# Altium schematic sheet [8] Sockets.SchDoc
size B; Organization: Altium Limited; Address1: L3, 12a Rodborough Rd; Address2: Frenchs Forest; Address3: NSW; Address4: Australia 2086
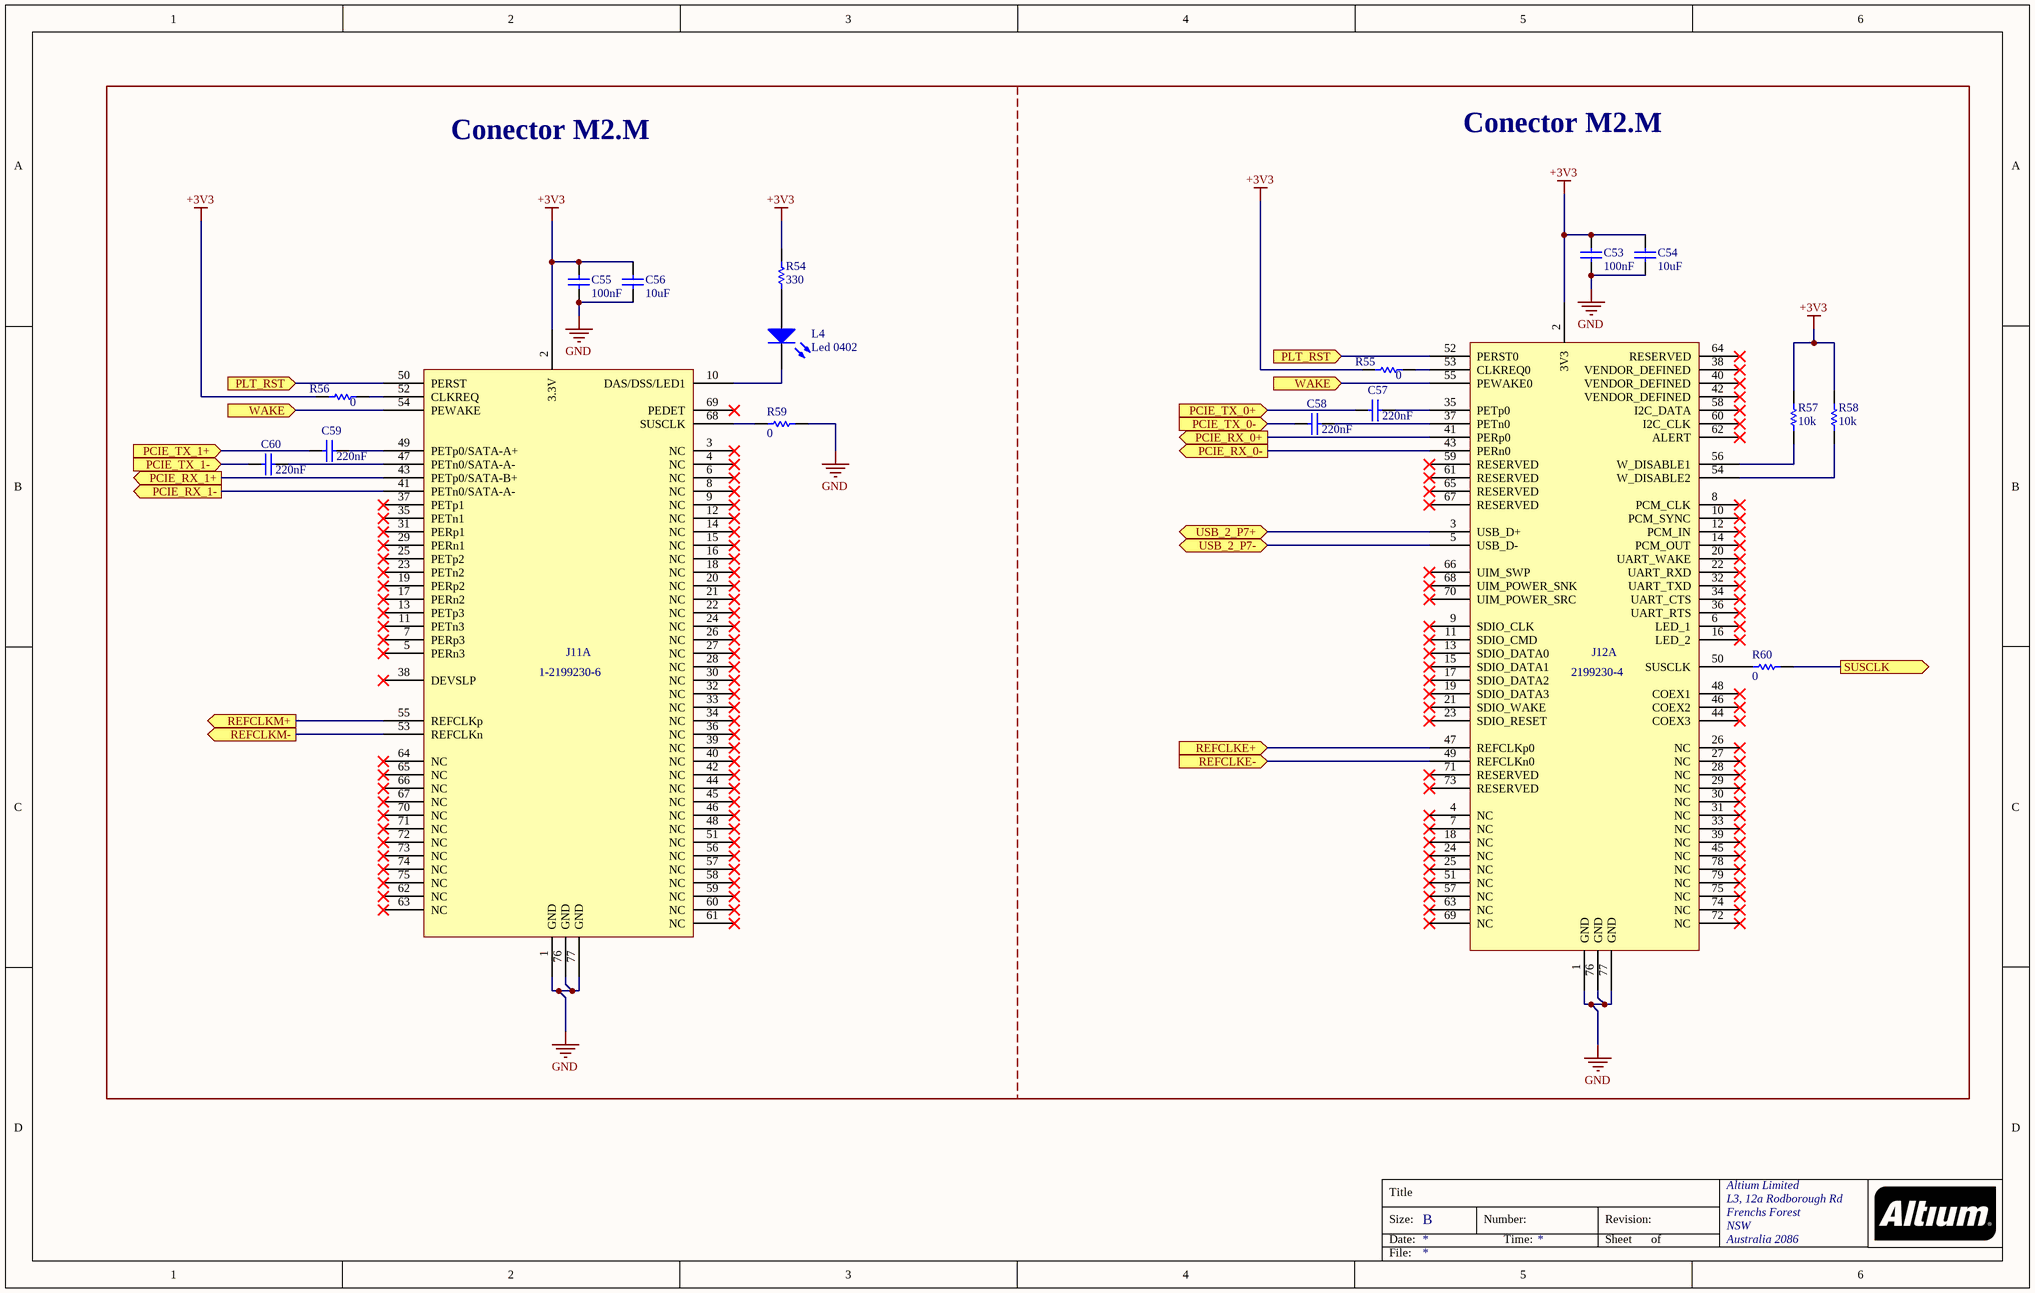
[diagram p0: [8] Sockets.SchDoc]

## Parts
C53  100nF  [Capacitor 0402]
C54  10uF  [Capacitor 0402]
C55  100nF  [Capacitor 0402]
C56  10uF  [Capacitor 0402]
C57  220nF  [Capacitor 0402]
C58  220nF  [Capacitor 0402]
C59  220nF  [Capacitor 0402]
C60  220nF  [Capacitor 0402]
J11  1-2199230-6  [CONN67_2199230_TEC]  (part A of 2)
J12  2199230-4  [CONN67_2199230_TEC]  (part A of 2)
L4  Led 0402  [LED 0402]
R54  330  [Resistencia 0402]
R55  0  [Resistencia 0402]
R56  0  [Resistencia 0402]
R57  10k  [Resistencia 0402]
R58  10k  [Resistencia 0402]
R59  0  [Resistencia 0402]
R60  0  [Resistencia 0402]

## Ports
PCIE_RX_0+ (out), PCIE_RX_0- (out), PCIE_RX_1+ (out), PCIE_RX_1- (out), PCIE_TX_0+ (in), PCIE_TX_0- (in), PCIE_TX_1+ (in), PCIE_TX_1- (in), PLT_RST (in), REFCLKE+ (in), REFCLKE- (in), REFCLKM+ (out), REFCLKM- (out), SUSCLK (out), USB_2_P7+ (bidir), USB_2_P7- (bidir), WAKE (in)

## Nets
+3V3: C53.2 C54.2 C55.2 C56.2 J11.2(3.3V) J12.2(3V3) R54.2(B) R55.1(A) R56.1(A) R57.2(B) R58.2(B)
GND: C53.1 C54.1 C55.1 C56.1 J11.1(GND) J11.76(GND) J11.77(GND) J12.1(GND) J12.76(GND) J12.77(GND) R59.1(A)
PCIE_RX_0+: J12.41(PERp0) ; port PCIE_RX_0+
PCIE_RX_0-: J12.43(PERn0) ; port PCIE_RX_0-
PCIE_RX_1+: J11.43(PETp0/SATA-B+) ; port PCIE_RX_1+
PCIE_RX_1-: J11.41(PETn0/SATA-A-) ; port PCIE_RX_1-
PCIE_TX_0+: C57.2 ; port PCIE_TX_0+
PCIE_TX_0-: C58.2 ; port PCIE_TX_0-
PCIE_TX_1+: C59.2 ; port PCIE_TX_1+
PCIE_TX_1-: C60.2 ; port PCIE_TX_1-
PLT_RST: J11.50(PERST) J12.52(PERST0) ; port PLT_RST
REFCLKE+: J12.47(REFCLKp0) ; port REFCLKE+
REFCLKE-: J12.49(REFCLKn0) ; port REFCLKE-
REFCLKM+: J11.55(REFCLKp) ; port REFCLKM+
REFCLKM-: J11.53(REFCLKn) ; port REFCLKM-
SUSCLK: R60.1(A) ; port SUSCLK
USB_2_P7+: J12.3(USB_D+) ; port USB_2_P7+
USB_2_P7-: J12.5(USB_D-) ; port USB_2_P7-
WAKE: J11.54(PEWAKE) J12.55(PEWAKE0) ; port WAKE
NetC57_1: C57.1 J12.35(PETp0)
NetC58_1: C58.1 J12.37(PETn0)
NetC59_1: C59.1 J11.49(PETp0/SATA-A+)
NetC60_1: C60.1 J11.47(PETn0/SATA-A-)
NetJ11_10: J11.10(DAS/DSS/LED1) L4.2(K)
NetJ11_52: J11.52(CLKREQ) R56.2(B)
NetJ11_68: J11.68(SUSCLK) R59.2(B)
NetJ12_50: J12.50(SUSCLK) R60.2(B)
NetJ12_53: J12.53(CLKREQ0) R55.2(B)
NetJ12_54: J12.54(W_DISABLE2) R58.1(A)
NetJ12_56: J12.56(W_DISABLE1) R57.1(A)
NetL4_1: L4.1(A) R54.1(A)

Not connected (* = marked no-connect by the designer): J11 3(NC)* 4(NC)* 5(PERn3_)* 6(NC)* 7(PERp3)* 8(NC)* 9(NC)* 11(PETn3)* 12(NC)* 13(PETp3)* 14(NC)* 15(NC)* 16(NC)* 17(PERn2_)* 18(NC)* 19(PERp2)* 20(NC)* 21(NC)* 22(NC)* 23(PETn2)* 24(NC)* 25(PETp2)* 26(NC)* 27(NC)* 28(NC)* 29(PERn1_)* 30(NC)* 31(PERp1)* 32(NC)* 33(NC)* 34(NC)* 35(PETn1_)* 36(NC)* 37(PETp1)* 38(DEVSLP)* 39(NC)* 40(NC)* 42(NC)* 44(NC)* 45(NC)* 46(NC)* 48(NC)* 51(NC)* 56(NC)* 57(NC)* 58(NC)* 59(NC)* 60(NC)* 61(NC)* 62(NC)* 63(NC)* 64(NC)* 65(NC)* 66(NC)* 67(NC)* 69(PEDET)* 70(NC)* 71(NC)* 72(NC)* 73(NC)* 74(NC)* 75(NC)*; J12 4(NC)* 6(LED_1)* 7(NC)* 8(PCM_CLK)* 9(SDIO_CLK)* 10(PCM_SYNC)* 11(SDIO_CMD)* 12(PCM_IN)* 13(SDIO_DATA0)* 14(PCM_OUT)* 15(SDIO_DATA1)* 16(LED_2)* 17(SDIO_DATA2)* 18(NC)* 19(SDIO_DATA3)* 20(UART_WAKE)* 21(SDIO_WAKE)* 22(UART_RXD)* 23(SDIO_RESET)* 24(NC)* 25(NC)* 26(NC)* 27(NC)* 28(NC)* 29(NC)* 30(NC)* 31(NC)* 32(UART_TXD)* 33(NC)* 34(UART_CTS)* 36(UART_RTS)* 38(VENDOR_DEFINED)* 39(NC)* 40(VENDOR_DEFINED)* 42(VENDOR_DEFINED)* 44(COEX3)* 45(NC)* 46(COEX2)* 48(COEX1)* 51(NC)* 57(NC)* 58(I2C_DATA)* 59(RESERVED)* 60(I2C_CLK)* 61(RESERVED)* 62(ALERT)* 63(NC)* 64(RESERVED)* 65(RESERVED)* 66(UIM_SWP)* 67(RESERVED)* 68(UIM_POWER_SNK)* 69(NC)* 70(UIM_POWER_SRC)* 71(RESERVED)* 72(NC)* 73(RESERVED)* 74(NC)* 75(NC)* 78(NC)* 79(NC)*

## Notes on the sheet
- Conector M2.M
- Title
- Size:
- Date:
- B
- Number:
- Time:
- Revision:
- Sheet
- of
- File:

## Library data of the parts
C53-C60 = Capacitor 0402: Capacitor Ceramico SMD 0402
J11 = 1-2199230-6: M.2 0.5PITCH 4.2H KEY M 30U AU; Manufacturer_Name: TE Connectivity; Copyright: Copyright (C) 2026 Ultra Librarian. All rights reserved.; Manufacturer_Part_Number: 1-2199230-6; RefDes: RefDes; Type: Type
J12 = 2199230-4: M.2 0.5PITCH 4.2H KEY E 15U'' AU; Manufacturer_Name: TE Connectivity; Copyright: Copyright (C) 2026 Ultra Librarian. All rights reserved.; Manufacturer_Part_Number: 2199230-4; RefDes: RefDes; Type: Type
L4 = LED 0402: LED SMD 0402
R54-R60 = Resistencia SMD 0402